# Altium schematic sheet RTC.SchDoc
size A4; SheetNumber: 11; SheetTotal: 11
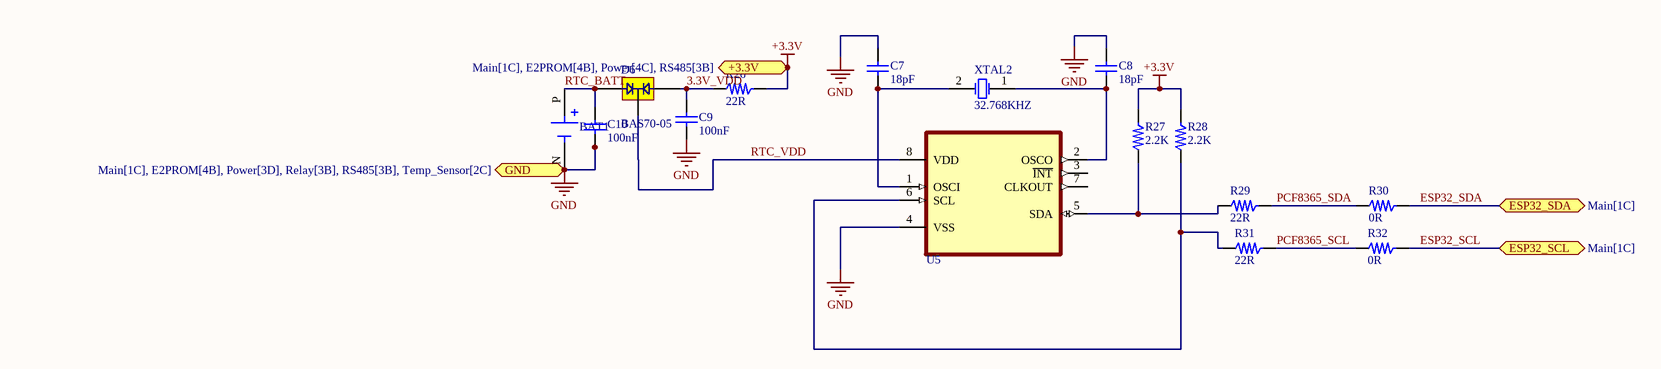
[diagram p0: RTC.SchDoc]

## Parts
BAT1  CR1220  [CR1220]  (value not drawn)
C7  18pF  [0805]
C8  18pF  [0805]
C9  100nF  [0805]
C10  100nF  [0805]
D6  BAS70-05  [BAS70-05]
R26  22R  [R0805]
R27  2.2K  [R0805]
R28  2.2K  [R0805]
R29  22R  [R0805]
R30  0R  [R0805]
R31  22R  [R0805]
R32  0R  [R0805]
U5  RTC  [PCF8563T]  (value not drawn)
XTAL2  32.768KHZ  [R38]

## Ports
+3.3V (bidir, see Main[1C], E2PROM[4B], Power[4C], RS485[3B]), ESP32_SCL (bidir, see Main[1C]), ESP32_SDA (bidir, see Main[1C]), GND (bidir, see Main[1C], E2PROM[4B], Power[3D], Relay[3B], RS485[3B], Temp_Sensor[2C])

## Nets
+3.3V: R26.2 R27.2 R28.2 ; port +3.3V
GND: BAT1.N(NEG) C7.1 C8.1 C9.2 C10.2 U5.4(VSS) ; port GND
3.3V_VDD: C9.1 D6.1 R26.1
ESP32_SCL: R32.2 ; port ESP32_SCL
ESP32_SDA: R30.2 ; port ESP32_SDA
PCF8365_SCL: R31.2 R32.1
PCF8365_SDA: R29.2 R30.1
RTC_BATT: BAT1.P(POS) C10.1 D6.2
RTC_VDD: D6.3 U5.8(VDD)
NetC7_2: C7.2 U5.1(OSCI) XTAL2.2(OSC2)
NetC8_2: C8.2 U5.2(OSCO) XTAL2.1(OSC1)
NetR27_1: R27.1 R29.1 U5.5(SDA)
NetR28_1: R28.1 R31.1 U5.6(SCL)

Not connected (* = marked no-connect by the designer): U5 3(~{INT}) 7(CLKOUT)

## Library data of the parts
BAT1 = CR1220: CR1220 SMD Battery holder
C7-C10 = 2-Cap: Bipolar Capacitor; Type: MKT
D6 = BAS70-05: Common cathode dual schottky diode
R26-R32 = myRes_1
  R26 R29 R31: Value: 22R
  R27 R28: Value: 2.2K
  R30 R32: Value: 0R
U5 = PCF8563T_F4
XTAL2 = XTAL_1: Crystal Oscillator; Published: 8-Jun-2000; LatestRevisionDate: 17-Jul-2002; LatestRevisionNote: Re-released for DXP Platform.; PackageReference: R38; Publisher: Altium Limited